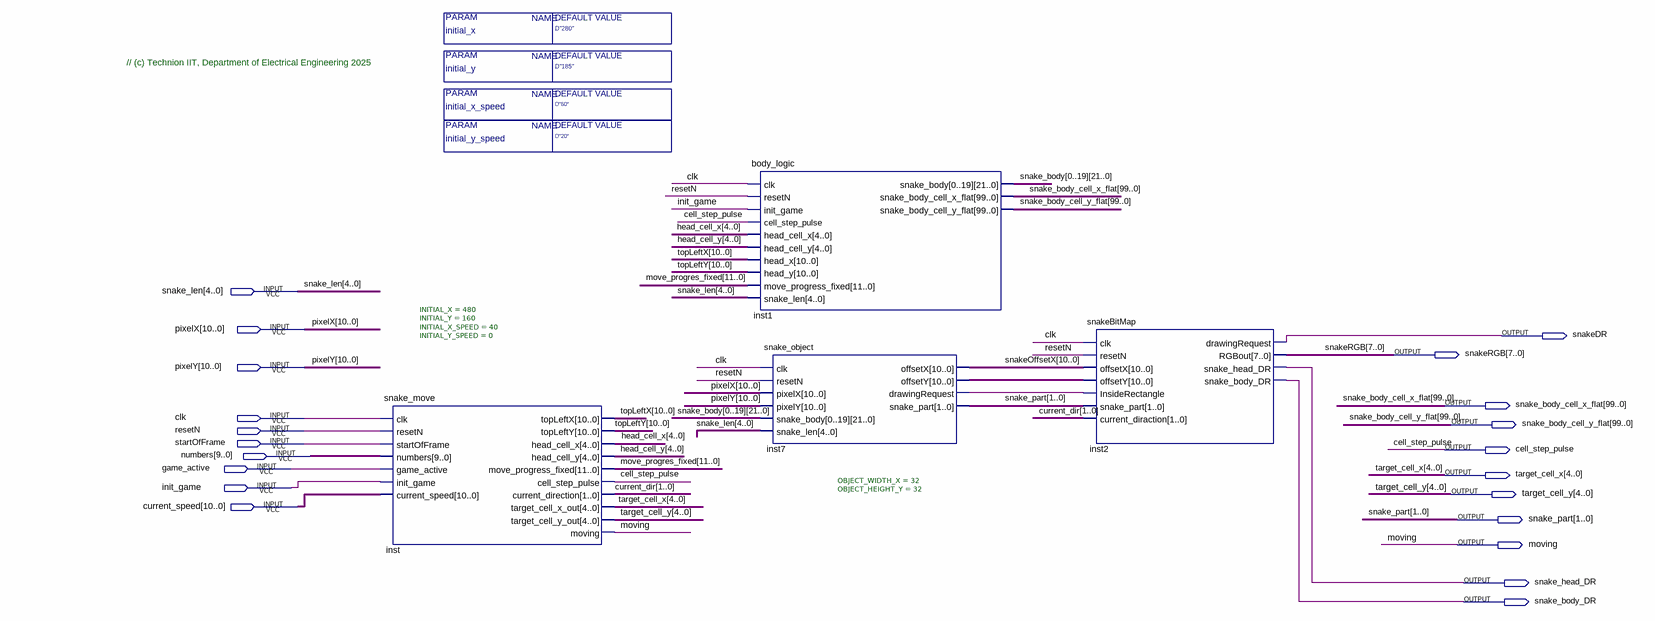
[diagram p0: schematic sheet]
// Quartus schematic Snake_Block_T.bdf as structural Verilog: 4 symbols, 21 pins
module Snake_Block_T #(parameter initial_x = "D\"280\"", parameter initial_y = "D\"185\"", parameter initial_x_speed = "D\"60\"", parameter initial_y_speed = "D\"20\"") (
  input  [4:0] snake_len,
  input  [10:0] pixelX,
  input  [10:0] pixelY,
  input  clk,
  input  resetN,
  input  startOfFrame,
  input  [9:0] numbers,
  input  game_active,
  input  init_game,
  input  [10:0] current_speed,
  output snakeDR,
  output [7:0] snakeRGB,
  output [99:0] snake_body_cell_x_flat,
  output [99:0] snake_body_cell_y_flat,
  output cell_step_pulse,
  output [4:0] target_cell_x,
  output [4:0] target_cell_y,
  output [1:0] snake_part,
  output moving,
  output snake_head_DR,
  output snake_body_DR
);

  wire inst7_drawingrequest;
  wire [1:0] current_dir;
  wire [4:0] head_cell_x, head_cell_y;
  wire [10:0] inst7_offsety, snakeOffsetX, topLeftX, topLeftY;
  wire [11:0] move_progres_fixed;
  wire [21:0] snake_body_0, snake_body_1, snake_body_2, snake_body_3, snake_body_4, snake_body_5,
       snake_body_6, snake_body_7, snake_body_8, snake_body_9, snake_body_10, snake_body_11, snake_body_12,
       snake_body_13, snake_body_14, snake_body_15, snake_body_16, snake_body_17, snake_body_18,
       snake_body_19;

  snake_move #(.INITIAL_X(480), .INITIAL_Y(160), .INITIAL_X_SPEED(40), .INITIAL_Y_SPEED(0)) inst (
    .clk(clk), .resetN(resetN), .startOfFrame(startOfFrame), .numbers(numbers), .game_active(game_active),
    .init_game(init_game), .current_speed(current_speed), .topLeftX(topLeftX), .topLeftY(topLeftY),
    .head_cell_x(head_cell_x), .head_cell_y(head_cell_y), .move_progress_fixed(move_progres_fixed),
    .cell_step_pulse(cell_step_pulse), .current_direction(current_dir), .target_cell_x_out(target_cell_x),
    .target_cell_y_out(target_cell_y), .moving(moving));
  body_logic inst1 (
    .clk(clk), .resetN(resetN), .init_game(init_game), .cell_step_pulse(cell_step_pulse),
    .head_cell_x(head_cell_x), .head_cell_y(head_cell_y), .head_x(topLeftX), .head_y(topLeftY),
    .move_progress_fixed(move_progres_fixed), .snake_len(snake_len),
    .snake_body({snake_body_0, snake_body_1, snake_body_2, snake_body_3, snake_body_4, snake_body_5, snake_body_6, snake_body_7, snake_body_8, snake_body_9, snake_body_10, snake_body_11, snake_body_12, snake_body_13, snake_body_14, snake_body_15, snake_body_16, snake_body_17, snake_body_18, snake_body_19}),
    .snake_body_cell_x_flat(snake_body_cell_x_flat), .snake_body_cell_y_flat(snake_body_cell_y_flat));
  snake_object #(.OBJECT_WIDTH_X(32), .OBJECT_HEIGHT_Y(32)) inst7 (
    .clk(clk), .resetN(resetN), .pixelX(pixelX), .pixelY(pixelY),
    .snake_body({snake_body_0, snake_body_1, snake_body_2, snake_body_3, snake_body_4, snake_body_5, snake_body_6, snake_body_7, snake_body_8, snake_body_9, snake_body_10, snake_body_11, snake_body_12, snake_body_13, snake_body_14, snake_body_15, snake_body_16, snake_body_17, snake_body_18, snake_body_19}),
    .snake_len(snake_len), .offsetX(snakeOffsetX), .offsetY(inst7_offsety),
    .drawingRequest(inst7_drawingrequest), .snake_part(snake_part));
  snakeBitMap inst2 (
    .clk(clk), .resetN(resetN), .offsetX(snakeOffsetX), .offsetY(inst7_offsety),
    .InsideRectangle(inst7_drawingrequest), .snake_part(snake_part), .current_diraction(current_dir),
    .drawingRequest(snakeDR), .RGBout(snakeRGB), .snake_head_DR(snake_head_DR), .snake_body_DR(snake_body_DR));

  // Notes on the sheet:
  //   // (c) Technion IIT, Department of Electrical Engineering 2025
endmodule
